# Altium project AVP32F2812_EVM_V1.0.PrjPcb
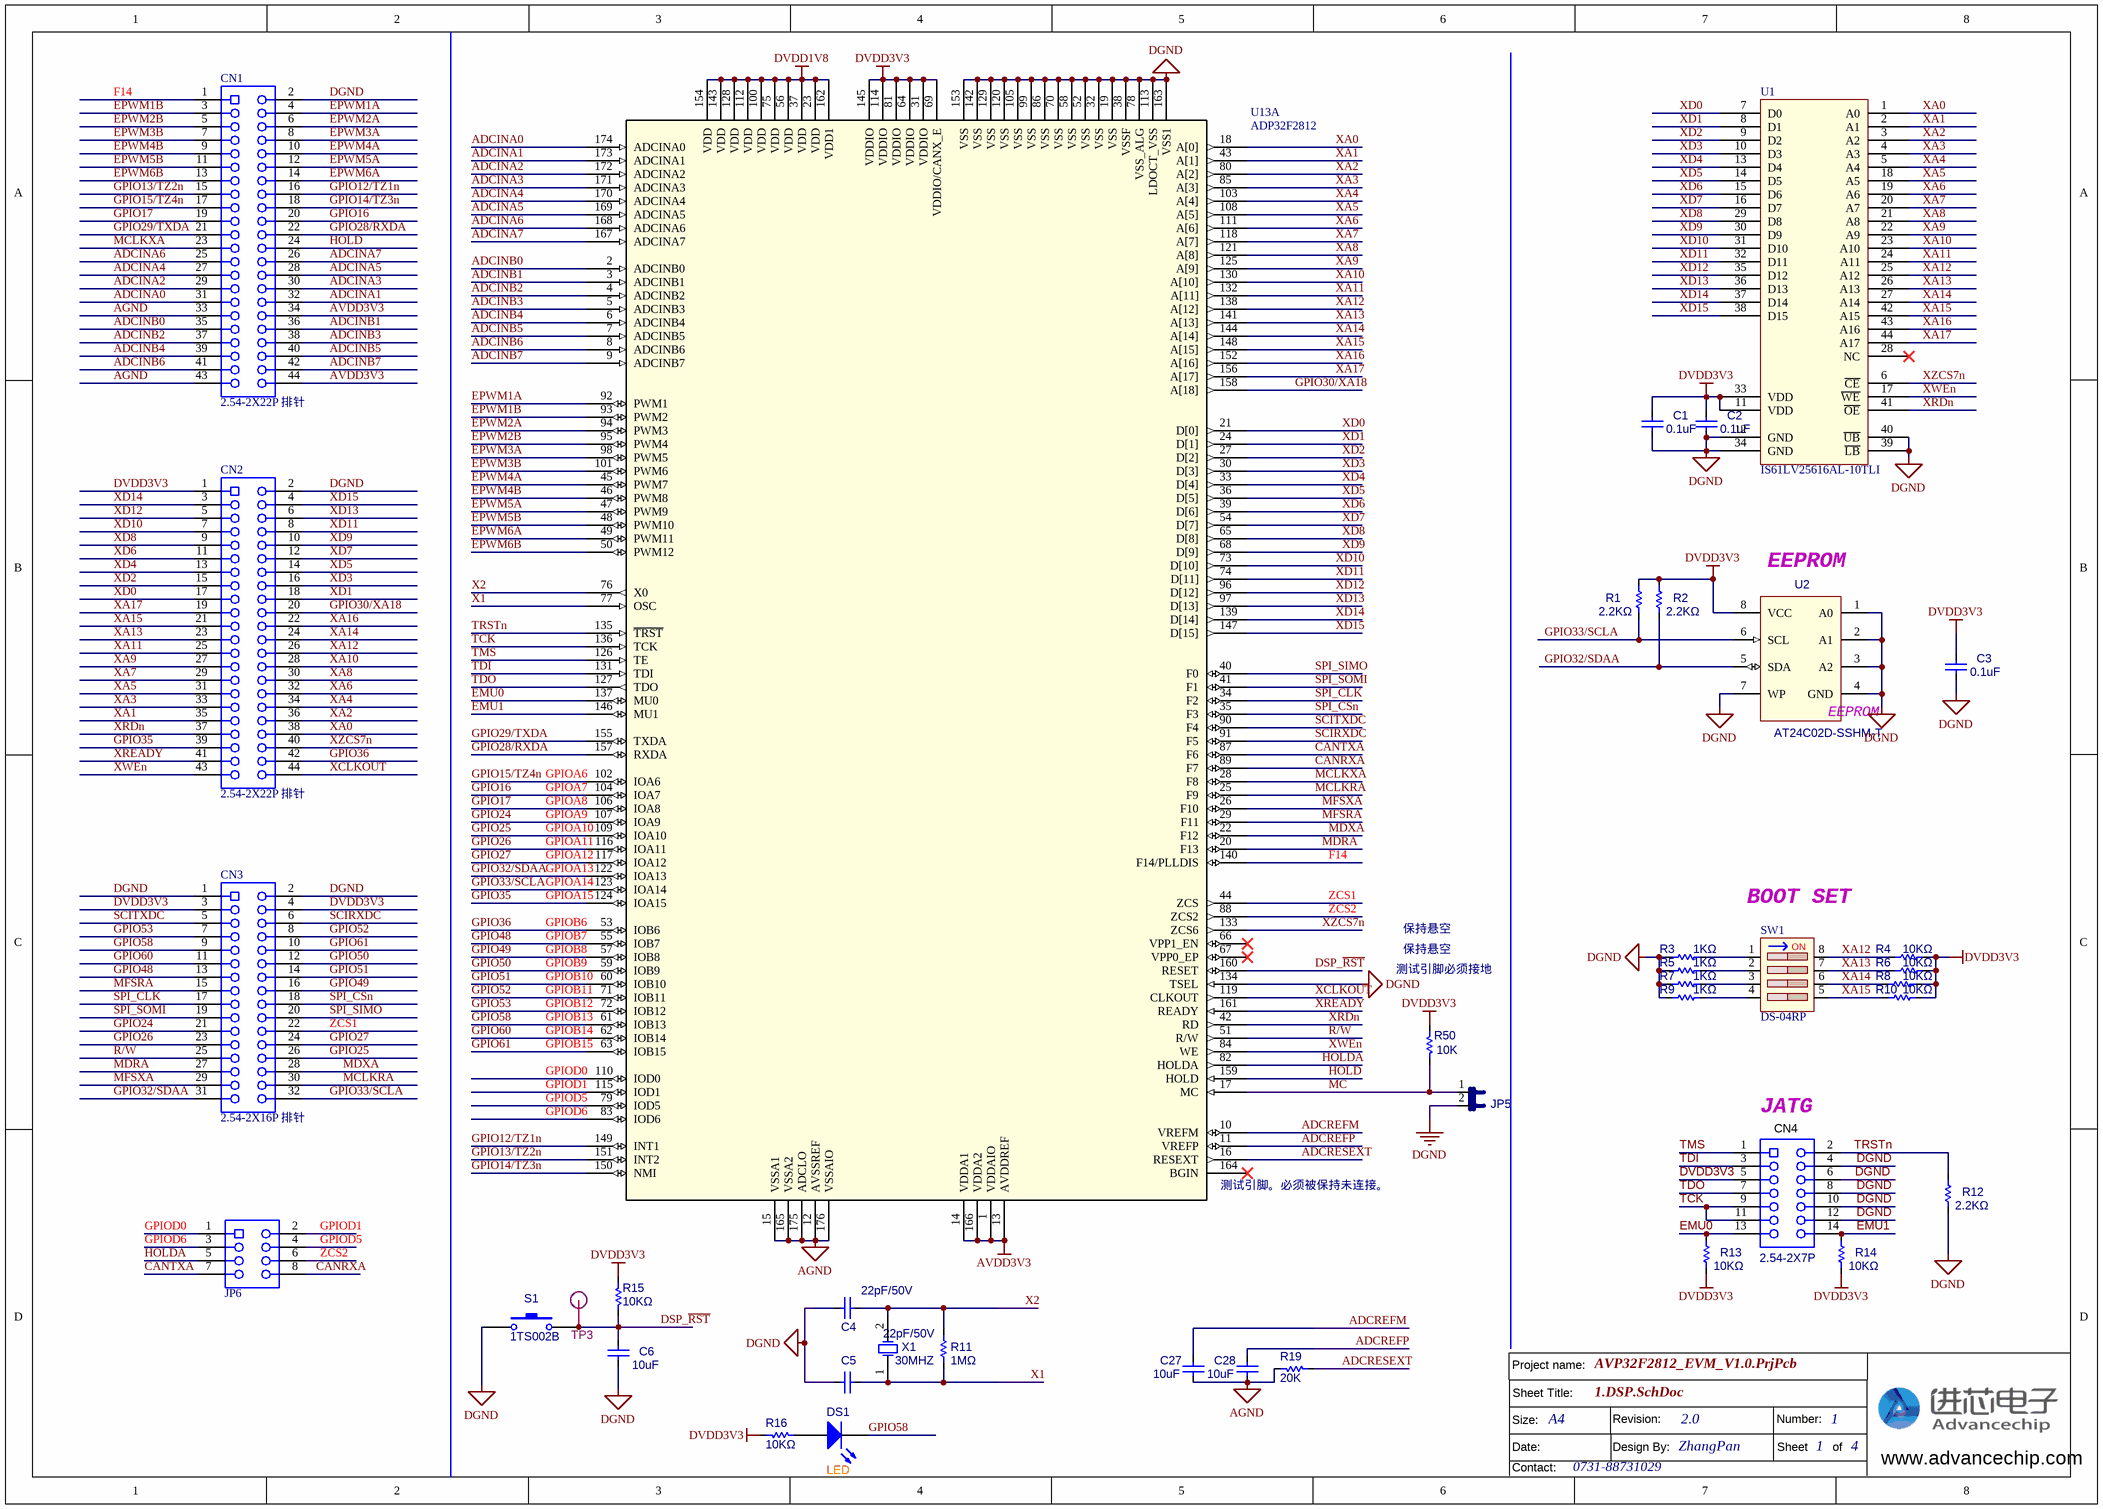
[diagram p0: 1.DSP.SchDoc]
4 sheets, 157 parts. Net scope: global (net labels, ports and power ports of the same name join across sheets).
Board file: AVP32F2812_EVM_V1.0.PcbDoc
Sheets:
  1.DSP.SchDoc
  2.Power.SchDoc
  3.uC Peripheral.SchDoc
  4.Communication Interface.SchDoc

## Sheet 1.DSP.SchDoc
size A3; Date: 2019/03/06; Author: ZhangPan; Revision: 2.0; SheetNumber: 1; SheetTotal: 4; Size: A4; Contact: 0731-88731029

### Parts
C1  value 0.1uF  [C0603]  (hidden comment: 0.1uF/50V)
C2  value 0.1uF  [C0603]  (hidden comment: 0.1uF/50V)
C3  value 0.1uF  [C0603]  (hidden comment: 0.1uF/50V)
C4  22pF/50V  [C0603 - duplicate]
C5  22pF/50V  [C0603]
C6  value 10uF  [C0805]  (hidden comment: 0.1uF/50V)
C27  value 10uF  [C0603 - duplicate]  (hidden comment: 2.2uF/25V)
C28  value 10uF  [C0603 - duplicate]  (hidden comment: 2.2uF/25V)
CN1  2.54-2X22P 排针  [IDC2X22]
CN2  2.54-2X22P 排针  [IDC2X22]
CN3  2.54-2X16P 排针  [IDC2X16]
CN4  value 2.54-2X7P  [IDC14-L]  (hidden comment: 2.54-2X7P 简易牛角母座)
DS1  LED  [SMD_LED0805_LED]
JP5  XH2.54-2P  [SIP2C]  (value not drawn)
JP6  2.54-2X7P 简易牛角母座  [HDR-TH_8P-P2.54-V-F-R2-C4-S2.54]  (value not drawn)
R1  2.2KΩ  [R0603]
R2  2.2KΩ  [R0603]
R3  1KΩ  [R0603]
R4  10KΩ  [R0603 - duplicate]
R5  1KΩ  [R0603]
R6  10KΩ  [R0603]
R7  1KΩ  [R0603]
R8  10KΩ  [R0603]
R9  1KΩ  [R0603]
R10  10KΩ  [R0603]
R11  1MΩ  [R0603]
R12  2.2KΩ  [R0603]
R13  10KΩ  [R0603]
R14  10KΩ  [R0603]
R15  10KΩ  [R0603]
R16  10KΩ  [R0603]
R19  20K  [R0603 - duplicate]
R50  10K  [R0603]
S1  value 1TS002B  [SW-3X6]  (hidden comment: 1TS002B-2400-5001-CT)
SW1  DS-04RP  [DIP-KEY-4]
TP3  RST  [TEST-0.8/1.5MM]  (value not drawn)
U1  IS61LV25616AL-10TLI  [TSOP-44_L18.4-W10.2-P0.80-LS11.8-BL]
U2  AT24C02D-SSHM-T  [SO-8]
U13  ADP32F2812  [AVP32F335]  (part A of 2)
X1  value 30MHZ  [XTAL_5032]  (hidden comment: YSX530GA 10MHZ 20pF 10ppm)

### Nets
AGND: C27.2 C28.2 CN1.33 CN1.43 R19.1 U13.12(AVSSREF) U13.15(VSSA1) U13.165(VSSA2) U13.175(ADCLO) U13.176(VSSAIO)
AVDD3V3: CN1.34 CN1.44 U13.1(VDDAIO) U13.13(AVDDREF) U13.14(VDDA1) U13.166(VDDA2)
DGND: C1.2 C2.2 C3.2 C4.2 C5.1 C6.2 CN1.2 CN2.2 CN3.1 CN3.2 CN4.4 CN4.6 CN4.8 CN4.10 CN4.12 JP5.2 R3.1 R5.1 R7.1 R9.1 R12.1 S1.2 U1.12(GND) U1.34(GND) U1.39(~{LB}) U1.40(~{UB}) U2.1(A0) U2.2(A1) U2.3(A2) U2.4(GND) U2.7(WP) U13.19(VSS) U13.32(VSS) U13.38(VSSF) U13.52(VSS) U13.58(VSS) U13.70(VSS) U13.78(VSS_ALG) U13.86(VSS) U13.99(VSS) U13.105(VSS) U13.113(LDOCT_VSS) U13.120(VSS) U13.129(VSS) U13.134(TSEL) U13.142(VSS) U13.153(VSS) U13.163(VSS1)
DVDD1V8: U13.23(VDD) U13.37(VDD) U13.56(VDD) U13.75(VDD) U13.100(VDD) U13.112(VDD) U13.128(VDD) U13.143(VDD) U13.154(VDD) U13.162(VDD1)
DVDD3V3: C1.1 C2.1 C3.1 CN2.1 CN3.3 CN3.4 CN4.5 R1.2 R2.2 R4.2 R6.2 R8.2 R10.2 R13.1 R14.1 R15.1 R16.1 R50.1 U1.11(VDD) U1.33(VDD) U2.8(VCC) U13.31(VDDIO) U13.64(VDDIO) U13.69(VDDIO/CANX_E) U13.81(VDDIO) U13.114(VDDIO) U13.145(VDDIO)
ADCINA0: CN1.31 U13.174(ADCINA0)
ADCINA1: CN1.32 U13.173(ADCINA1)
ADCINA2: CN1.29 U13.172(ADCINA2)
ADCINA3: CN1.30 U13.171(ADCINA3)
ADCINA4: CN1.27 U13.170(ADCINA4)
ADCINA5: CN1.28 U13.169(ADCINA5)
ADCINA6: CN1.25 U13.168(ADCINA6)
ADCINA7: CN1.26 U13.167(ADCINA7)
ADCINB0: CN1.35 U13.2(ADCINB0)
ADCINB1: CN1.36 U13.3(ADCINB1)
ADCINB2: CN1.37 U13.4(ADCINB2)
ADCINB3: CN1.38 U13.5(ADCINB3)
ADCINB4: CN1.39 U13.6(ADCINB4)
ADCINB5: CN1.40 U13.7(ADCINB5)
ADCINB6: CN1.41 U13.8(ADCINB6)
ADCINB7: CN1.42 U13.9(ADCINB7)
ADCREFM: C27.1 U13.10(VREFM)
ADCREFP: C28.1 U13.11(VREFP)
ADCRESEXT: R19.2 U13.16(RESEXT)
CANRXA: JP6.8 U13.89(F7)
CANTXA: JP6.7 U13.87(F6)
DSP_~{RST}: C6.1 R15.2 S1.1 TP3.1 U13.160(RESET)
EMU0: CN4.13 R13.2 U13.137(MU0)
EMU1: CN4.14 R14.2 U13.146(MU1)
EPWM1A: CN1.4 U13.92(PWM1)
EPWM1B: CN1.3 U13.93(PWM2)
EPWM2A: CN1.6 U13.94(PWM3)
EPWM2B: CN1.5 U13.95(PWM4)
EPWM3A: CN1.8 U13.98(PWM5)
EPWM3B: CN1.7 U13.101(PWM6)
EPWM4A: CN1.10 U13.45(PWM7)
EPWM4B: CN1.9 U13.46(PWM8)
EPWM5A: CN1.12 U13.47(PWM9)
EPWM5B: CN1.11 U13.48(PWM10)
EPWM6A: CN1.14 U13.49(PWM11)
EPWM6B: CN1.13 U13.50(PWM12)
F14: CN1.1 U13.140(F14/PLLDIS)
GPIO12/TZ1n: CN1.16 U13.149(INT1)
GPIO13/TZ2n: CN1.15 U13.151(INT2)
GPIO14/TZ3n: CN1.18 U13.150(NMI)
GPIO15/TZ4n: CN1.17 U13.102(IOA6)  [also labelled GPIOA6]
GPIO16: CN1.20 U13.104(IOA7)  [also labelled GPIOA7]
GPIO17: CN1.19 U13.106(IOA8)  [also labelled GPIOA8]
GPIO24: CN3.21 U13.107(IOA9)  [also labelled GPIOA9]
GPIO25: CN3.26 U13.109(IOA10)  [also labelled GPIOA10]
GPIO26: CN3.23 U13.116(IOA11)  [also labelled GPIOA11]
GPIO27: CN3.24 U13.117(IOA12)  [also labelled GPIOA12]
GPIO28/RXDA: CN1.22 U13.157(RXDA)
GPIO29/TXDA: CN1.21 U13.155(TXDA)
GPIO30/XA18: CN2.20 U13.158(A[18])
GPIO32/SDAA: CN3.31 R2.1 U2.5(SDA) U13.122(IOA13)  [also labelled GPIOA13]
GPIO33/SCLA: CN3.32 R1.1 U2.6(SCL) U13.123(IOA14)  [also labelled GPIOA14]
GPIO35: CN2.39 U13.124(IOA15)  [also labelled GPIOA15]
GPIO36: CN2.42 U13.53(IOB6)  [also labelled GPIOB6]
GPIO48: CN3.13 U13.55(IOB7)  [also labelled GPIOB7]
GPIO49: CN3.16 U13.57(IOB8)  [also labelled GPIOB8]
GPIO50: CN3.12 U13.59(IOB9)  [also labelled GPIOB9]
GPIO51: CN3.14 U13.60(IOB10)  [also labelled GPIOB10]
GPIO52: CN3.8 U13.71(IOB11)  [also labelled GPIOB11]
GPIO53: CN3.7 U13.72(IOB12)  [also labelled GPIOB12]
GPIO58: CN3.9 DS1.2(K) U13.61(IOB13)  [also labelled GPIOB13]
GPIO60: CN3.11 U13.62(IOB14)  [also labelled GPIOB14]
GPIO61: CN3.10 U13.63(IOB15)  [also labelled GPIOB15]
GPIOD0: JP6.1 U13.110(IOD0)
GPIOD1: JP6.2 U13.115(IOD1)
GPIOD5: JP6.4 U13.79(IOD5)
GPIOD6: JP6.3 U13.83(IOD6)
HOLD: CN1.24 U13.159(HOLD)
HOLDA: JP6.5 U13.82(HOLDA)
MC: JP5.1 R50.2 U13.17(MC)
MCLKRA: CN3.30 U13.25(F9)
MCLKXA: CN1.23 U13.28(F8)
MDRA: CN3.27 U13.20(F13)
MDXA: CN3.28 U13.22(F12)
MFSRA: CN3.15 U13.29(F11)
MFSXA: CN3.29 U13.26(F10)
R/W: CN3.25 U13.51(R/W)
SCIRXDC: CN3.6 U13.91(F5)
SCITXDC: CN3.5 U13.90(F4)
SPI_CLK: CN3.17 U13.34(F2)
SPI_CSn: CN3.18 U13.35(F3)
SPI_SIMO: CN3.20 U13.40(F0)
SPI_SOMI: CN3.19 U13.41(F1)
TCK: CN4.9 CN4.11 U13.136(TCK)
TDI: CN4.3 U13.131(TDI)
TDO: CN4.7 U13.127(TDO)
TMS: CN4.1 U13.126(TE)
TRSTn: CN4.2 R12.2 U13.135(~{TRST})
X1: C5.2 R11.2 U13.77(OSC) X1.1(OSC1)
X2: C4.1 R11.1 U13.76(X0) X1.2(OSC2)
XA0: CN2.38 U1.1(A0) U13.18(A[0])
XA1: CN2.35 U1.2(A1) U13.43(A[1])
XA2: CN2.36 U1.3(A2) U13.80(A[2])
XA3: CN2.33 U1.4(A3) U13.85(A[3])
XA4: CN2.34 U1.5(A4) U13.103(A[4])
XA5: CN2.31 U1.18(A5) U13.108(A[5])
XA6: CN2.32 U1.19(A6) U13.111(A[6])
XA7: CN2.29 U1.20(A7) U13.118(A[7])
XA8: CN2.30 U1.21(A8) U13.121(A[8])
XA9: CN2.27 U1.22(A9) U13.125(A[9])
XA10: CN2.28 U1.23(A10) U13.130(A[10])
XA11: CN2.25 U1.24(A11) U13.132(A[11])
XA12: CN2.26 R4.1 SW1.8 U1.25(A12) U13.138(A[12])
XA13: CN2.23 R6.1 SW1.7 U1.26(A13) U13.141(A[13])
XA14: CN2.24 R8.1 SW1.6 U1.27(A14) U13.144(A[14])
XA15: CN2.21 R10.1 SW1.5 U1.42(A15) U13.148(A[15])
XA16: CN2.22 U1.43(A16) U13.152(A[16])
XA17: CN2.19 U1.44(A17) U13.156(A[17])
XCLKOUT: CN2.44 U13.119(CLKOUT)
XD0: CN2.17 U1.7(D0) U13.21(D[0])
XD1: CN2.18 U1.8(D1) U13.24(D[1])
XD2: CN2.15 U1.9(D2) U13.27(D[2])
XD3: CN2.16 U1.10(D3) U13.30(D[3])
XD4: CN2.13 U1.13(D4) U13.33(D[4])
XD5: CN2.14 U1.14(D5) U13.36(D[5])
XD6: CN2.11 U1.15(D6) U13.39(D[6])
XD7: CN2.12 U1.16(D7) U13.54(D[7])
XD8: CN2.9 U1.29(D8) U13.65(D[8])
XD9: CN2.10 U1.30(D9) U13.68(D[9])
XD10: CN2.7 U1.31(D10) U13.73(D[10])
XD11: CN2.8 U1.32(D11) U13.74(D[11])
XD12: CN2.5 U1.35(D12) U13.96(D[12])
XD13: CN2.6 U1.36(D13) U13.97(D[13])
XD14: CN2.3 U1.37(D14) U13.139(D[14])
XD15: CN2.4 U1.38(D15) U13.147(D[15])
XRDn: CN2.37 U1.41(~{OE}) U13.42(RD)
XREADY: CN2.41 U13.161(READY)
XWEn: CN2.43 U1.17(~{WE}) U13.84(WE)
XZCS7n: CN2.40 U1.6(~{CE}) U13.133(ZCS6)
ZCS1: CN3.22 U13.44(ZCS)
ZCS2: JP6.6 U13.88(ZCS2)
NetDS1_1: DS1.1(A) R16.2
NetR3_2: R3.2 SW1.1
NetR5_2: R5.2 SW1.2
NetR7_2: R7.2 SW1.3
NetR9_2: R9.2 SW1.4

Not connected (* = marked no-connect by the designer): U1 28(NC)*; U13 66(VPP1_EN)* 67(VPP0_EP)* 164(BGIN)*

### Notes on the sheet
- (near U2) EEPROM
- BOOT SET
- 测试引脚必须接地
- 保持悬空
- (near CN4) JATG
- (near U13) 测试引脚。必须被保持未连接。
- Sheet Title:
- Project name:
- Size:
- Date:
- Contact:
- Revision:
- Design By:
- Number:
- Sheet       of
- www.advancechip.com
- (in symbol AT24C02C) EEPROM
- (in symbol SW-4B) ON

### Library data of the parts
C1-C3 C6 C27 C28 = Cap: 贴片电容; Published: 8-Jun-2000; LatestRevisionDate: 17-Jul-2002; LatestRevisionNote: Re-released for DXP Platform.; Publisher: Altium Limited
C4 C5 = Cap: COG贴片电容; Value: 100pF; Published: 8-Jun-2000; LatestRevisionDate: 17-Jul-2002; LatestRevisionNote: Re-released for DXP Platform.; Publisher: Altium Limited
CN1 CN2 = CON 22X2A: 连接器
CN3 = CON 16X2A: 连接器
CN4 JP6 = Receptacle_7X2: 连接器
DS1 = LED0: 发光二极管; Published: 8-Jun-2000; LatestRevisionDate: 08-Jul-2005; LatestRevisionNote: Mech Layer 1 removed.; PackageReference: LED-0; Publisher: Altium Limited; PackageDescription: LED; 2 Leads
JP5 = JP2: 连接器+跳线帽
R1-R16 R19 = Res: 贴片电阻; Value: 1K; Published: 8-Jun-2000; LatestRevisionDate: 17-Jul-2002; LatestRevisionNote: Re-released for DXP Platform.; Publisher: Altium Limited
R50 = Res: 贴片电阻; Published: 8-Jun-2000; LatestRevisionDate: 17-Jul-2002; LatestRevisionNote: Re-released for DXP Platform.; Publisher: Altium Limited
S1 = SW-PB: 鸿源精密轻触开关3X6; Published: 24-Mar-1999; LatestRevisionDate: 17-Jul-2002; LatestRevisionNote: Re-released for DXP Platform.; Publisher: Altium Limited
SW1 = SW-4B: 红色2PIN-2.54mm立式直插正拨拨码开关; Published: 24-Mar-1999; LatestRevisionDate: 17-Jul-2002; LatestRevisionNote: Re-released for DXP Platform.; Publisher: Altium Limited
TP3 = TP: 测试点
U1 = IS61LV25616AL-10TLI: 无锡中微LED驱动芯片
U2 = AT24C02C: EEPROM存储器
U13 = ADP32F2812: Mfr_Name: Texas Instruments; RefDes: RefDes; Type: Type
X1 = XTAL: 5032贴片无源晶振; Published: 8-Jun-2000; LatestRevisionDate: 17-Jul-2002; LatestRevisionNote: Re-released for DXP Platform.; Publisher: Altium Limited

## Sheet 2.Power.SchDoc: TopLevel Schematic
size A4; Date: 2019/03/06; Author: ZhangPan; Revision: 2.0; SheetNumber: 2; SheetTotal: 4; Size: A4; Contact: 0731-88731029
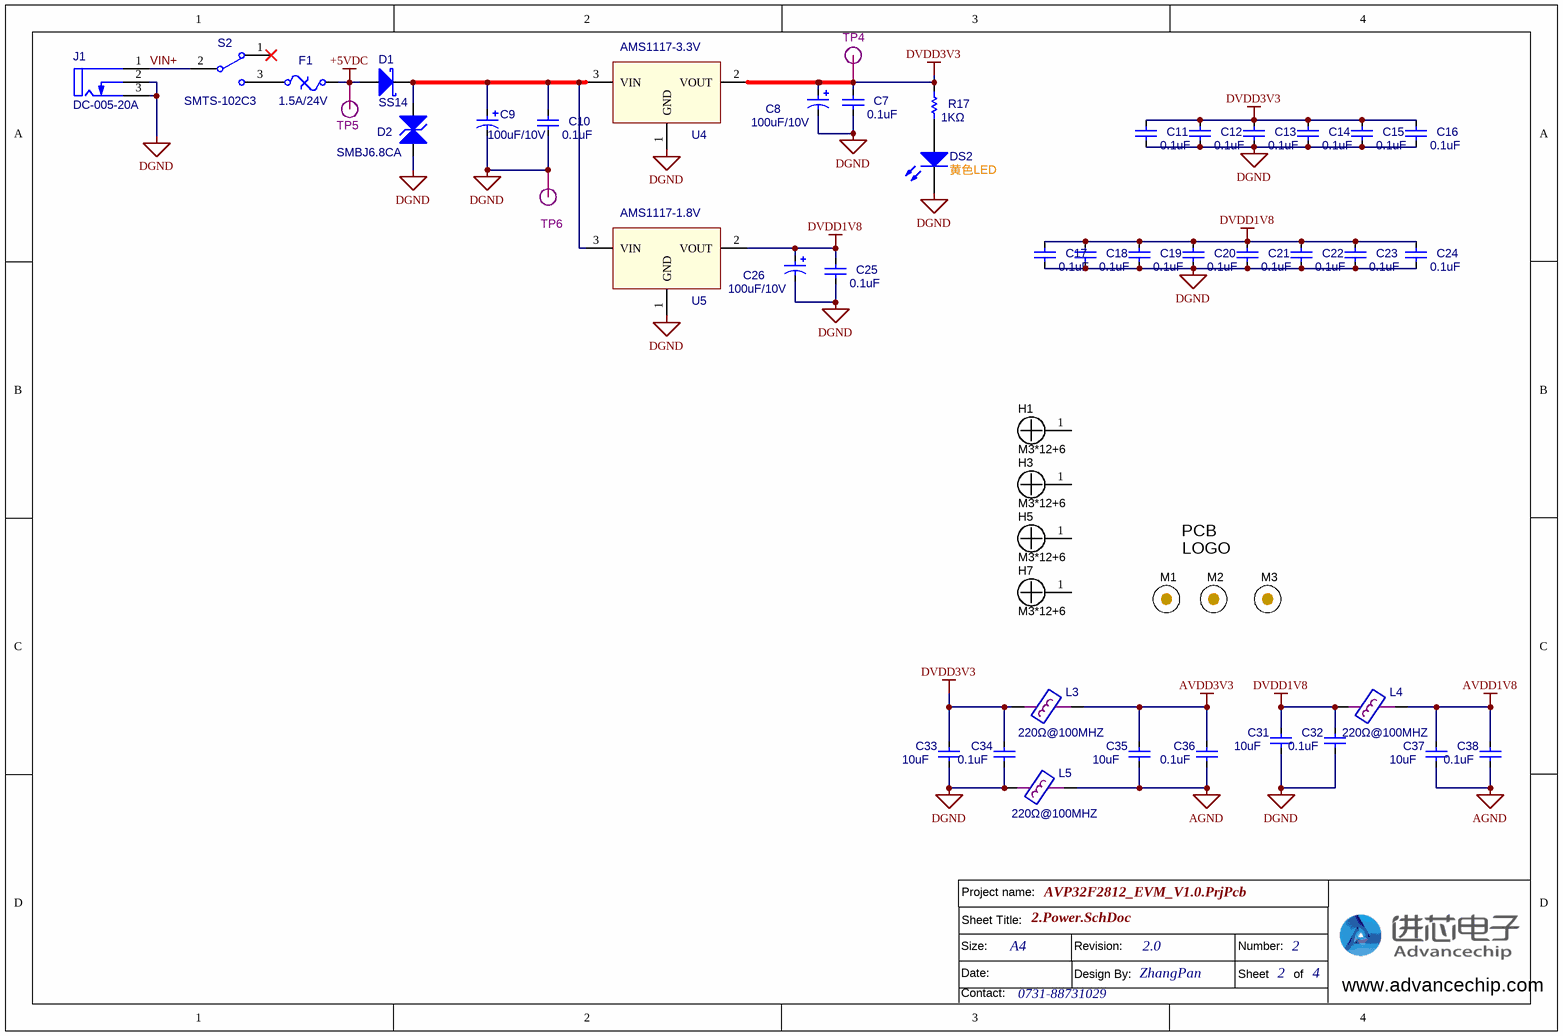
[diagram p1: 2.Power.SchDoc]

### Parts
C7  value 0.1uF  [C0603]  (hidden comment: 0.1uF/50V)
C8  100uF/10V  [CASE-B_3528]
C9  100uF/10V  [CASE-B_3528]
C10  value 0.1uF  [C0603]  (hidden comment: 0.1uF/50V)
C11  value 0.1uF  [C0603]  (hidden comment: 0.1uF/50V)
C12  value 0.1uF  [C0603]  (hidden comment: 0.1uF/50V)
C13  value 0.1uF  [C0603 - duplicate]  (hidden comment: 0.1uF/50V)
C14  value 0.1uF  [C0603]  (hidden comment: 0.1uF/50V)
C15  value 0.1uF  [C0603]  (hidden comment: 0.1uF/50V)
C16  value 0.1uF  [C0603]  (hidden comment: 0.1uF/50V)
C17  value 0.1uF  [C0603]  (hidden comment: 0.1uF/50V)
C18  value 0.1uF  [C0603]  (hidden comment: 0.1uF/50V)
C19  value 0.1uF  [C0603]  (hidden comment: 0.1uF/50V)
C20  value 0.1uF  [C0603]  (hidden comment: 0.1uF/50V)
C21  value 0.1uF  [C0603]  (hidden comment: 0.1uF/50V)
C22  value 0.1uF  [C0603]  (hidden comment: 0.1uF/50V)
C23  value 0.1uF  [C0603]  (hidden comment: 0.1uF/50V)
C24  value 0.1uF  [C0603]  (hidden comment: 0.1uF/50V)
C25  value 0.1uF  [C0603]  (hidden comment: 0.1uF/50V)
C26  100uF/10V  [CASE-B_3528]
C31  value 10uF  [C0603 - duplicate]  (hidden comment: 2.2uF/25V)
C32  value 0.1uF  [C0603]  (hidden comment: 2.2uF/25V)
C33  value 10uF  [C0603]  (hidden comment: 2.2uF/25V)
C34  value 0.1uF  [C0603]  (hidden comment: 2.2uF/25V)
C35  value 10uF  [C0603]  (hidden comment: 2.2uF/25V)
C36  value 0.1uF  [C0603]  (hidden comment: 2.2uF/25V)
C37  value 10uF  [C0603]  (hidden comment: 2.2uF/25V)
C38  value 0.1uF  [C0603]  (hidden comment: 2.2uF/25V)
D1  SS14  [SMA]
D2  SMBJ6.8CA  [SMB2]
DS2  黄色LED  [SMD_LED0805_LED]
F1  1.5A/24V  [1812_PTC_NP]
H1  M3*12+6  [NY PMS 440 0025 PH]
H3  M3*12+6  [NY PMS 440 0025 PH]
H5  M3*12+6  [NY PMS 440 0025 PH]
H7  M3*12+6  [NY PMS 440 0025 PH]
J1  DC-005-20A  [DC-005]
L3  value 220Ω@100MHZ  [L-0805]  (hidden comment: BLM21PG221SN)
L4  value 220Ω@100MHZ  [L-0805]  (hidden comment: BLM21PG221SN)
L5  value 220Ω@100MHZ  [L-0805]  (hidden comment: BLM21PG221SN)
Logo1  CAUTION.  READ USER GUIDE BEFORE USE  [IEC_Caution_Small]  (value not drawn)  (no BOM)
M1  (no value)  [Mark1]
M2  (no value)  [Mark1]
M3  (no value)  [Mark1]
R17  1KΩ  [R0603]
S2  SMTS-102C3  [SW2]
TP4  +3V3  [TEST-0.8/1.5MM]  (value not drawn)
TP5  VIN+  [TEST-0.8/1.5MM]  (value not drawn)
TP6  DGND  [TEST-0.8/1.5MM]  (value not drawn)
U4  AMS1117-3.3V  [SOT-223]
U5  AMS1117-1.8V  [SOT-223]

### Nets
+5VDC: D1.1 F1.2 TP5.1
AGND: C35.2 C36.2 C37.2 C38.2 L5.2
AVDD1V8: C37.1 C38.1 L4.2
AVDD3V3: C35.1 C36.1 L3.2
DGND: C7.2 C8.2 C9.2 C10.2 C11.2 C12.2 C13.2 C14.2 C15.2 C16.2 C17.2 C18.2 C19.2 C20.2 C21.2 C22.2 C23.2 C24.2 C25.2 C26.2 C31.2 C32.2 C33.2 C34.2 D2.1(A) DS2.2(K) J1.2 J1.3 L5.1 TP6.1 U4.1(GND) U5.1(GND)
DVDD1V8: C17.1 C18.1 C19.1 C20.1 C21.1 C22.1 C23.1 C24.1 C25.1 C26.1 C31.1 C32.1 L4.1 U5.2(VOUT)
DVDD3V3: C7.1 C8.1 C11.1 C12.1 C13.1 C14.1 C15.1 C16.1 C33.1 C34.1 L3.1 R17.1 TP4.1 U4.2(VOUT)
VIN+: J1.1 S2.2
NetC9_1: C9.1 C10.1 D1.2 D2.2(K) U4.3(VIN) U5.3(VIN)
NetDS2_1: DS2.1(A) R17.2
NetF1_1: F1.1 S2.3

Not connected (* = marked no-connect by the designer): H1 1; H3 1; H5 1; H7 1; S2 1*

### Notes on the sheet
- Sheet Title:
- Project name:
- Size:
- Date:
- Contact:
- Revision:
- Design By:
- Number:
- Sheet       of
- www.advancechip.com
- (in symbol CMP-0074836-1) PCB; LOGO

### Library data of the parts
C7 C10-C25 C31-C38 = Cap: 贴片电容; Published: 8-Jun-2000; LatestRevisionDate: 17-Jul-2002; LatestRevisionNote: Re-released for DXP Platform.; Publisher: Altium Limited
C8 C9 C26 = CAP2: 钽电容; Brand Name: 三星; Tolerance error: 10%; cost: ￥0.01
D1 = D Schottky: 肖特基二极管; Published: 8-Jun-2000; LatestRevisionDate: 17-Jul-2002; LatestRevisionNote: Re-released for DXP Platform.; Publisher: Altium Limited; Code_JEDEC: DO-214-AA
D2 = TVS: TVS二极管; Published: 8-Jun-2000; LatestRevisionDate: 17-Jul-2002; LatestRevisionNote: Re-released for DXP Platform.; Publisher: Altium Limited
DS2 = LED0: 发光二极管; Published: 8-Jun-2000; LatestRevisionDate: 08-Jul-2005; LatestRevisionNote: Mech Layer 1 removed.; PackageReference: LED-0; Publisher: Altium Limited; PackageDescription: LED; 2 Leads
F1 = Fuse Thermal: 自恢复保险丝; Published: 24-Mar-1999; LatestRevisionDate: 17-Jul-2002; LatestRevisionNote: Re-released for DXP Platform.; PackageReference: PIN-W2/E2.8; Publisher: Altium Limited
H1 H3 H5 H7 = CMP-0003617-1: 安装孔
J1 = DC-005: DC电源接口，内径2.1mm; Published: 24-Mar-1999; LatestRevisionDate: 17-Jul-2002; LatestRevisionNote: Re-released for DXP Platform.; Publisher: Altium Limited
L3-L5 = FB1: 贴片电感; Code_IEC: 1005; Published: 8-Jun-2000; LatestRevisionDate: 29-May-2009; LatestRevisionNote: IPC-7351 Footprint Added.; PackageReference: 0402-A; Publisher: Altium Limited; PackageDescription: Chip Inductor; Code_JEITA: 0402
Logo1 = CMP-0074836-1: IEC 61010-1 Caution Warning
M1-M3 = CMP-0077181-1: MARK点
R17 = Res: 贴片电阻; Value: 1K; Published: 8-Jun-2000; LatestRevisionDate: 17-Jul-2002; LatestRevisionNote: Re-released for DXP Platform.; Publisher: Altium Limited
S2 = SW-SPDT: 红色卧式弯脚小型扭子开关5脚2档; Published: 24-Mar-1999; LatestRevisionDate: 17-Dec-2003; LatestRevisionNote: Schematic revised, PCB Footprint replaced.; DatasheetDocument: 05-Dec-2000; Publisher: Altium Limited
TP4-TP6 = TP: 测试点
U4 U5 = ASM1117-3.3V: 线性稳压器

## Sheet 3.uC Peripheral.SchDoc: TopLevel Schematic
size A4; Date: 2019/03/06; Author: ZhangPan; Revision: 2.0; SheetNumber: 3; SheetTotal: 4; Size: A4; Contact: 0731-88731029; ProjectName: EVM
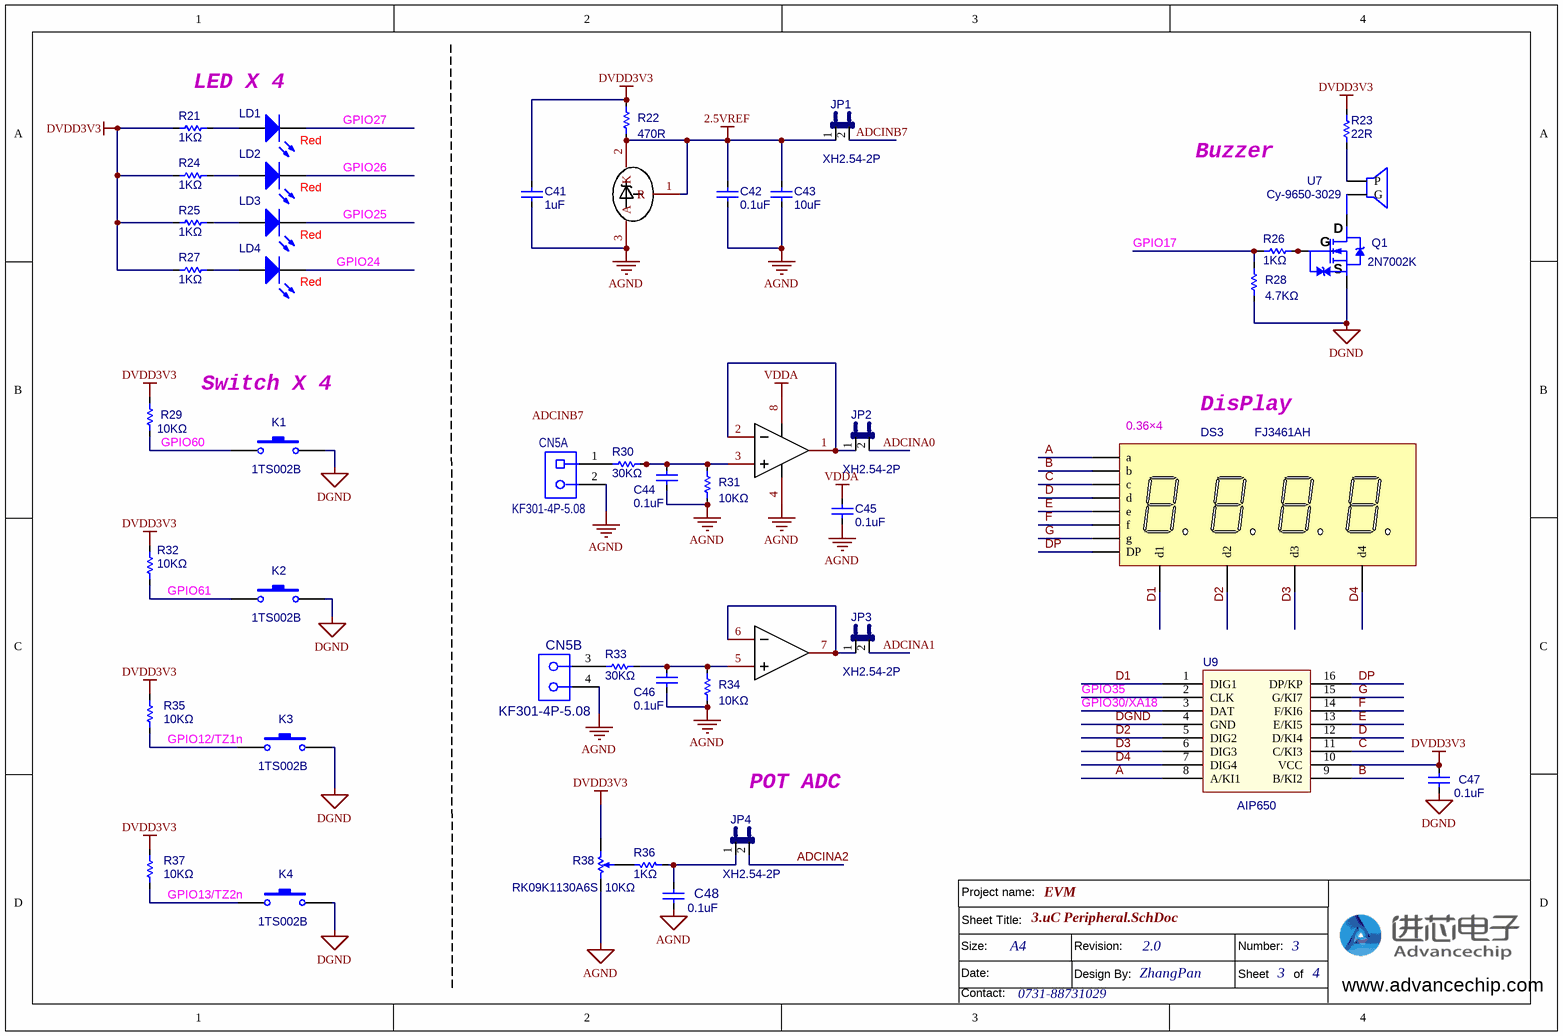
[diagram p2: 3.uC Peripheral.SchDoc]

### Parts
C41  value 1uF  [C0603]  (hidden comment: 0.1uF/50V)
C42  value 0.1uF  [C0603]  (hidden comment: 0.1uF/50V)
C43  value 10uF  [C0603]  (hidden comment: 0.1uF/50V)
C44  value 0.1uF  [C0603]  (hidden comment: 0.1uF/50V)
C45  value 0.1uF  [C0603]  (hidden comment: 0.1uF/50V)
C46  value 0.1uF  [C0603 - duplicate]  (hidden comment: 0.1uF/50V)
C47  value 0.1uF  [C0603]  (hidden comment: 0.1uF/50V)
C48  value 0.1uF  [C0603]  (hidden comment: 0.1uF/50V)
CN5  KF301-4P-5.08  [J-DG128-4]  (parts A,B of 2)
DS3  FJ3461AH  value 0.36×4  [0.36X4]
JP1  XH2.54-2P  [SIP2C]
JP2  XH2.54-2P  [SIP2C]
JP3  XH2.54-2P  [SIP2C]
JP4  XH2.54-2P  [SIP2C]
K1  value 1TS002B  [SW-3X6]  (hidden comment: 1TS002B-2400-5001-CT)
K2  value 1TS002B  [SW-3X6]  (hidden comment: 1TS002B-2400-5001-CT)
K3  value 1TS002B  [SW-3X6]  (hidden comment: 1TS002B-2400-5001-CT)
K4  value 1TS002B  [SW-3X6]  (hidden comment: 1TS002B-2400-5001-CT)
LD1  Red  [SMD_LED0805_LED]
LD2  Red  [SMD_LED0805_LED]
LD3  Red  [SMD_LED0805_LED]
LD4  Red  [SMD_LED0805_LED]
Q1  2N7002K  [MOS-SOT23]
R21  1KΩ  [R0603 - duplicate]
R22  470R  [R0603]
R23  22R  [1206RX]
R24  1KΩ  [R0603]
R25  1KΩ  [R0603]
R26  1KΩ  [R0603]
R27  1KΩ  [R0603]
R28  4.7KΩ  [R0603 - duplicate]
R29  10KΩ  [R0603]
R30  30KΩ  [R0603 - duplicate]
R31  10KΩ  [R0603]
R32  10KΩ  [R0603]
R33  30KΩ  [R0603]
R34  10KΩ  [R0603 - duplicate]
R35  10KΩ  [R0603]
R36  1KΩ  [R0603]
R37  10KΩ  [R0603]
R38  RK09K1130A6S  10KΩ  [RK09K1130]
U6  TL431_C963380  [SOT-23-3_L2.9-W1.4-P1.90-LS2.6-BR]  (value not drawn)
U7  Cy-9650-3029  [SUN-0905-3V]
U8  LM358_C5252902  [SOP-8_L4.9-W3.9-P1.27-LS6.0-BL]  (value not drawn)  (parts A,B of 2)
U9  AIP650  [SOIC-16_150mil]

### Nets
2.5VREF: C42.2 C43.2 JP1.1 R22.2 U6.1(R) U6.2(K)
AGND: C41.1 C42.1 C43.1 C44.1 C45.1 C46.1 C48.2 CN5.2 CN5.4 R31.2 R34.2 R38.1 U6.3(A) U8.4(VEE)
DGND: C47.2 K1.2 K2.2 K3.2 K4.2 Q1.S R28.2 U9.4(GND)
DVDD3V3: C41.2 C47.1 R21.2 R22.1 R23.1 R24.2 R25.2 R27.2 R29.1 R32.1 R35.1 R37.1 R38.3 U9.10(VCC)
VDDA: C45.2 U8.8(VCC)
A: DS3.a U9.8(A/KI1)
ADCINA0: JP2.2
ADCINA1: JP3.2
ADCINA2: JP4.2
ADCINB7: JP1.2
B: DS3.b U9.9(B/KI2)
C: DS3.c U9.11(C/KI3)
D: DS3.d U9.12(D/KI4)
D1: DS3.com1(d1) U9.1(DIG1)
D2: DS3.com2(d2) U9.5(DIG2)
D3: DS3.com3(d3) U9.6(DIG3)
D4: DS3.com4(d4) U9.7(DIG4)
DP: DS3.dp(DP) U9.16(DP/KP)
E: DS3.e U9.13(E/KI5)
F: DS3.f U9.14(F/KI6)
G: DS3.g U9.15(G/KI7)
GPIO12/TZ1n: K3.1 R35.2
GPIO13/TZ2n: K4.1 R37.2
GPIO17: R26.2 R28.1
GPIO24: LD4.2(K)
GPIO25: LD3.2(K)
GPIO26: LD2.2(K)
GPIO27: LD1.2(K)
GPIO30/XA18: U9.3(DAT)
GPIO35: U9.2(CLK)
GPIO60: K1.1 R29.2
GPIO61: K2.1 R32.2
NetC44_2: C44.2 R30.2 R31.1 U8.3(IN1+)
NetC46_2: C46.2 R33.2 R34.1 U8.5(IN2+)
NetC48_1: C48.1 JP4.1 R36.2
NetCN5_1: CN5.1 R30.1
NetCN5_3: CN5.3 R33.1
NetJP2_1: JP2.1 U8.1(OUT1) U8.2(IN1-)
NetJP3_1: JP3.1 U8.6(IN2-) U8.7(OUT2)
NetLD1_1: LD1.1(A) R21.1
NetLD2_1: LD2.1(A) R24.1
NetLD3_1: LD3.1(A) R25.1
NetLD4_1: LD4.1(A) R27.1
NetQ1_D: Q1.D U7.2(G)
NetQ1_G: Q1.G R26.1
NetR23_2: R23.2 U7.1(P)
NetR36_1: R36.1 R38.2

### Notes on the sheet
- LED X 4
- Buzzer
- Switch X 4
- (near DS3) DisPlay
- POT ADC
- Labels drawn without touching a wire or pin: ADCINB7
- Sheet Title:
- Project name:
- Size:
- Date:
- Contact:
- Revision:
- Design By:
- Number:
- Sheet       of
- www.advancechip.com

### Library data of the parts
C41-C48 = Cap: 贴片电容; Published: 8-Jun-2000; LatestRevisionDate: 17-Jul-2002; LatestRevisionNote: Re-released for DXP Platform.; Publisher: Altium Limited
CN5 = CON4: 连接器
DS3 = Dpy Amber-4K: 4位0.36英寸红色共阴七段数码管; 焊接类型: 直插; ComponentLink1URL: *; ComponentLink2Description: *; ComponentLink2URL: *; ComponentLink3Description: *; ComponentLink3URL: *; Pin: 12
JP1-JP4 = JP2: 连接器+跳线帽
K1-K4 = SW-PB: 鸿源精密轻触开关3X6; Published: 24-Mar-1999; LatestRevisionDate: 17-Jul-2002; LatestRevisionNote: Re-released for DXP Platform.; Publisher: Altium Limited
LD1-LD4 = LED0: 发光二极管; Published: 8-Jun-2000; LatestRevisionDate: 08-Jul-2005; LatestRevisionNote: Mech Layer 1 removed.; PackageReference: LED-0; Publisher: Altium Limited; PackageDescription: LED; 2 Leads
Q1 = 2SK3019: N-MOSFET 60V300mA低开启电压; Published: 8-Jun-2000; LatestRevisionDate: 17-Jul-2002; LatestRevisionNote: Re-released for DXP Platform.; Publisher: Altium Limited
R21-R37 = Res: 贴片电阻; Value: 1K; Published: 8-Jun-2000; LatestRevisionDate: 17-Jul-2002; LatestRevisionNote: Re-released for DXP Platform.; Publisher: Altium Limited
R38 = RPot SM: 立式可调电位器; Published: 17-Dec-2003; DatasheetDocument: Oct-2003; Publisher: Altium Limited
U6 = TL431_C963380: Name: TL431; Add into BOM: yes; Input Voltage: 37V; Output Voltage: 2.5V~36V; Minimum Cathode Current for Regulation: 1mA; Symbol: TL431_C963380; Device: TL431_C963380; Supplier Part: C963380; Manufacturer Part: TL431; Supplier Footprint: SOT-23; JLCPCB Part Class: Extended Part; Supplier: LCSC; Convert to PCB: yes; Output Current: -; Tolerance: -; Supply Current: -; Noise - 1/10Hz to 10Hz: -; Noise - 10Hz to 10kHz: -
U7 = BEEP: 超音V有源蜂鸣器 电磁式 脚距5,外径9.5mm
U8 = LM358_C5252902: Name: LM358; Add into BOM: yes; Number of Circuits: 2; Voltage - Input Offset(Vos): 5mV; Gain Bandwidth Product(GBP): 1.2MHz; Symbol: LM358_C5252902; Device: LM358_C5252902; Supplier Part: C5252902; Manufacturer Part: LM358; Supplier Footprint: SOP-8; JLCPCB Part Class: Extended Part; Datasheet: https://atta.szlcsc.com/upload/public/pdf/source/20221111/EFA130B3B4599AE68A453AC9B85C4BC9.pdf; Supplier: LCSC; Convert to PCB: yes
U9 = AIP650E: 无锡中微LED驱动芯片

## Sheet 4.Communication Interface.SchDoc
size A4; Author: ZhangPan; Revision: 2.0; SheetNumber: 4; SheetTotal: 4; Size: A3; Contact: 0731-88731029
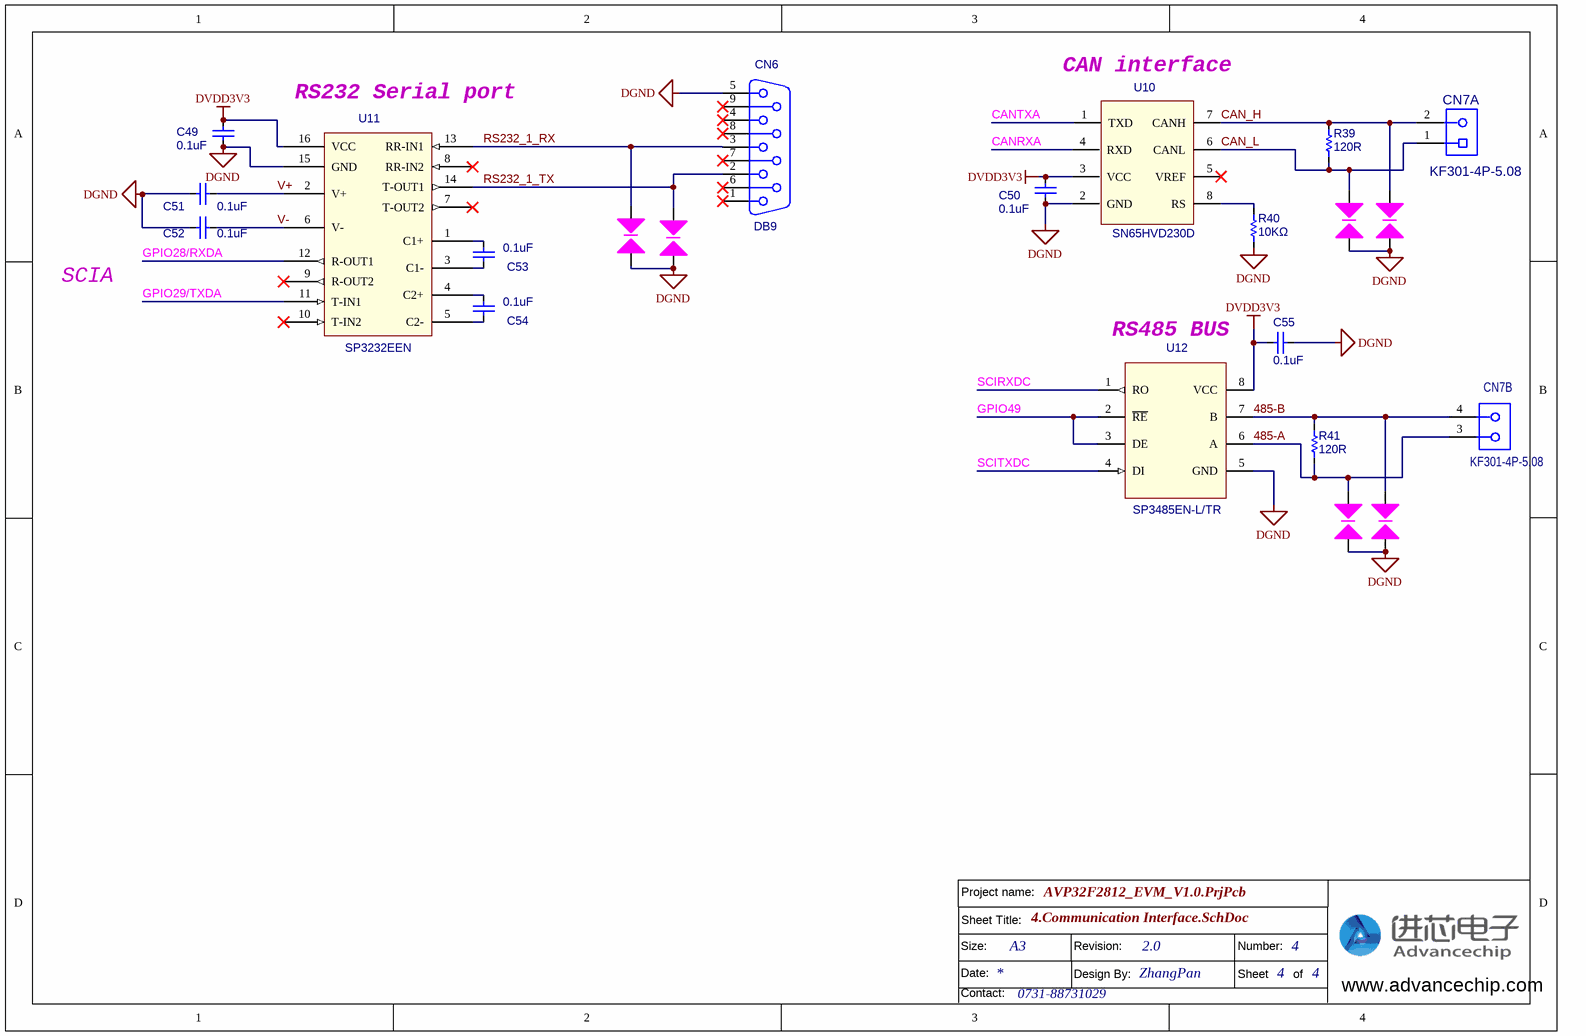
[diagram p3: 4.Communication Interface.SchDoc]

### Parts
C49  value 0.1uF  [C0603]  (hidden comment: 0.1uF/50V)
C50  value 0.1uF  [C0603]  (hidden comment: 0.1uF/50V)
C51  value 0.1uF  [C0603]  (hidden comment: 0.1uF/50V)
C52  value 0.1uF  [C0603]  (hidden comment: 0.1uF/50V)
C53  value 0.1uF  [C0603]  (hidden comment: 0.1uF/50V)
C54  value 0.1uF  [C0603]  (hidden comment: 0.1uF/50V)
C55  value 0.1uF  [C0603 - duplicate]  (hidden comment: 0.1uF/50V)
CN6  DB9  [db9]
CN7  KF301-4P-5.08  [J-DG128-4]  (parts A,B of 2)
R39  120R  [1206RX]
R40  10KΩ  [R0603]
R41  120R  [1206RX]
T1  SPARK_GAP  [SPARK_GAP]  (value not drawn)
T2  SPARK_GAP  [SPARK_GAP]  (value not drawn)
T3  SPARK_GAP  [SPARK_GAP]  (value not drawn)
T4  SPARK_GAP  [SPARK_GAP]  (value not drawn)
T5  SPARK_GAP  [SPARK_GAP]  (value not drawn)
T6  SPARK_GAP  [SPARK_GAP]  (value not drawn)
U10  SN65HVD230D  [SO-8]
U11  SP3232EEN  [SOIC-16_150mil]
U12  SP3485EN-L/TR  [SO-8]

### Nets
DGND: C49.2 C50.2 C51.2 C52.2 C55.2 CN6.5 R40.1 T1.2(A) T2.2(A) T3.2(A) T4.2(A) T5.2(A) T6.2(A) U10.2(GND) U11.15(GND) U12.5(GND)
DVDD3V3: C49.1 C50.1 C55.1 U10.3(VCC) U11.16(VCC) U12.8(VCC)
485-A: CN7.3 R41.1 T5.1(A) U12.6(A)
485-B: CN7.4 R41.2 T6.1(A) U12.7(B)
CAN_H: CN7.2 R39.2 T2.1(A) U10.7(CANH)
CAN_L: CN7.1 R39.1 T1.1(A) U10.6(CANL)
CANRXA: U10.4(RXD)
CANTXA: U10.1(TXD)
GPIO28/RXDA: U11.12(R-OUT1)
GPIO29/TXDA: U11.11(T-IN1)
GPIO49: U12.2(~{RE}) U12.3(DE)
RS232_1_RX: CN6.3 T3.1(A) U11.13(RR-IN1)
RS232_1_TX: CN6.2 T4.1(A) U11.14(T-OUT1)
SCIRXDC: U12.1(RO)
SCITXDC: U12.4(DI)
V+: C51.1 U11.2(V+)
V-: C52.1 U11.6(V-)
NetC53_1: C53.1 U11.1(C1+)
NetC53_2: C53.2 U11.3(C1-)
NetC54_1: C54.1 U11.4(C2+)
NetC54_2: C54.2 U11.5(C2-)
NetR40_2: R40.2 U10.8(RS)

Not connected (* = marked no-connect by the designer): CN6 1* 4* 6* 7* 8* 9*; U10 5(VREF)*; U11 7(T-OUT2)* 8(RR-IN2)* 9(R-OUT2)* 10(T-IN2)*

### Notes on the sheet
- (near U11) RS232 Serial port
- (near U10) CAN interface
- SCIA
- RS485 BUS
- Sheet Title:
- Project name:
- Size:
- Date:
- Contact:
- Revision:
- Design By:
- Number:
- Sheet       of
- www.advancechip.com

### Library data of the parts
C49-C55 = Cap: 贴片电容; Published: 8-Jun-2000; LatestRevisionDate: 17-Jul-2002; LatestRevisionNote: Re-released for DXP Platform.; Publisher: Altium Limited
CN6 = D Connector 9: DB9插座; PackageDocument: O; Positions: 9; Gender: Receptacle; Published: 15-Jun-2001; LatestRevisionDate: 17-Jul-2002; LatestRevisionNote: Re-released for DXP Platform.; DatasheetDocument: 1-Sep-1999; PackageReference: 788750; Publisher: Altium Limited; Orientation: Right Angle
CN7 = CON4: 连接器
R39 = Res: 贴片电阻; Published: 8-Jun-2000; LatestRevisionDate: 17-Jul-2002; LatestRevisionNote: Re-released for DXP Platform.; Publisher: Altium Limited
R40 R41 = Res: 贴片电阻; Value: 1K; Published: 8-Jun-2000; LatestRevisionDate: 17-Jul-2002; LatestRevisionNote: Re-released for DXP Platform.; Publisher: Altium Limited
T1-T6 = GND SIDE: 静电GAP
U10 = SN65HVD230D: 3.3V CAN通讯
U11 = MAX232: 低压232通讯芯片
U12 = SP3485E: 3.3V 485总线收发器

## Nets that join several sheets
AGND: 1.DSP (10 pins), 2.Power (5 pins), 3.uC Peripheral (14 pins)
AVDD3V3: 1.DSP (6 pins), 2.Power (C35.1 C36.1 L3.2)
DGND: 1.DSP (48 pins), 2.Power (32 pins), 3.uC Peripheral (8 pins), 4.Communication Interface (16 pins)
DVDD1V8: 1.DSP (10 pins), 2.Power (14 pins)
DVDD3V3: 1.DSP (27 pins), 2.Power (14 pins), 3.uC Peripheral (14 pins), 4.Communication Interface (6 pins)
ADCINA0: 1.DSP (CN1.31 U13.174), 3.uC Peripheral (JP2.2)
ADCINA1: 1.DSP (CN1.32 U13.173), 3.uC Peripheral (JP3.2)
ADCINA2: 1.DSP (CN1.29 U13.172), 3.uC Peripheral (JP4.2)
ADCINB7: 1.DSP (CN1.42 U13.9), 3.uC Peripheral (JP1.2)
CANRXA: 1.DSP (JP6.8 U13.89), 4.Communication Interface (U10.4)
CANTXA: 1.DSP (JP6.7 U13.87), 4.Communication Interface (U10.1)
GPIO12/TZ1n: 1.DSP (CN1.16 U13.149), 3.uC Peripheral (K3.1 R35.2)
GPIO13/TZ2n: 1.DSP (CN1.15 U13.151), 3.uC Peripheral (K4.1 R37.2)
GPIO17: 1.DSP (CN1.19 U13.106), 3.uC Peripheral (R26.2 R28.1)
GPIO24: 1.DSP (CN3.21 U13.107), 3.uC Peripheral (LD4.2)
GPIO25: 1.DSP (CN3.26 U13.109), 3.uC Peripheral (LD3.2)
GPIO26: 1.DSP (CN3.23 U13.116), 3.uC Peripheral (LD2.2)
GPIO27: 1.DSP (CN3.24 U13.117), 3.uC Peripheral (LD1.2)
GPIO28/RXDA: 1.DSP (CN1.22 U13.157), 4.Communication Interface (U11.12)
GPIO29/TXDA: 1.DSP (CN1.21 U13.155), 4.Communication Interface (U11.11)
GPIO30/XA18: 1.DSP (CN2.20 U13.158), 3.uC Peripheral (U9.3)
GPIO35: 1.DSP (CN2.39 U13.124), 3.uC Peripheral (U9.2)
GPIO49: 1.DSP (CN3.16 U13.57), 4.Communication Interface (U12.2 U12.3)
GPIO60: 1.DSP (CN3.11 U13.62), 3.uC Peripheral (K1.1 R29.2)
GPIO61: 1.DSP (CN3.10 U13.63), 3.uC Peripheral (K2.1 R32.2)
SCIRXDC: 1.DSP (CN3.6 U13.91), 4.Communication Interface (U12.1)
SCITXDC: 1.DSP (CN3.5 U13.90), 4.Communication Interface (U12.4)